# EasyEDA Pro project lovelessing-d133-mobile-phone-development-bo-91bf7213.epro, board PCB2_1
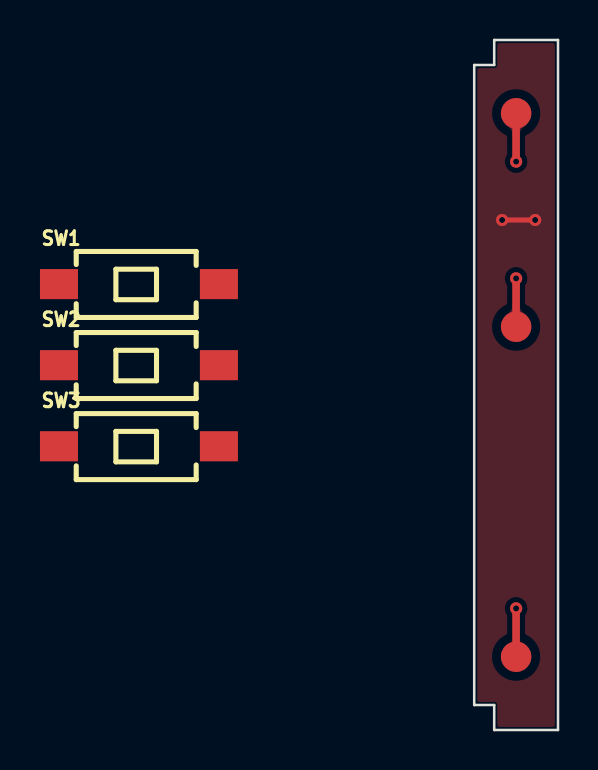
[diagram p11: board, top side]
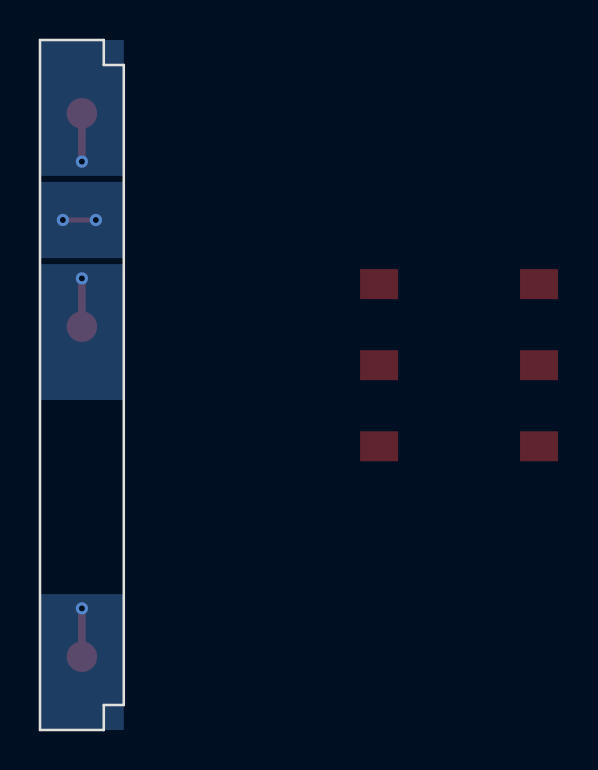
[diagram p12: board, bottom side, seen from below]

Outline 4.19 x 34.5 mm; copper layers: Top Layer, Bottom Layer. Coordinates in mm from the lower left corner of the outline.
Outline path: 0,1.25 0,33.25 1,33.25 1,34.5 4.19,34.5 4.19,0 1,0 1,1.25 0,1.25
Stack: Top Layer 0.035mm / Dielectric1 0.91mm FR4 er 4.5 / Bottom Layer 0.035mm

## Design rules (mm)
spacing copperThickness1oz (default): track to track 0.102, other pairs 0.152 to 0.3
spacing copperThickness2oz: track to track 0.203, other pairs 0.152 to 0.3
spacing Plane_innerPlane: track to track 0.102, other pairs 0.152 to 0.3
spacing Copper_copperRegion: track to track 0.102, other pairs 0.152 to 0.3
track width copperThickness1oz (default): min 0.127, default 0.254, max 2.54
track width copperThickness2oz: min 0.203, default 0.254, max 2.54
differential pair differentialPair (default): width min 0.127, default 0.254, max 2.54; gap min 0.152, default 0.152
pour e27 uses Copper_copperRegion

## Placement (name value [footprint] x y rotation side)
NOREF  -  [Pad_e8]  2.1 3.66 0 top
NOREF#2  -  [Pad_e6]  2.1 30.83 0 top
NOREF#3  -  [Pad_e7]  2.1 20.16 0 top
SW1  TS-1101-C-W  [SW-SMD_L6.0-W3.3-LS8.0]  -16.77 22.29 0 top
SW2  TS-1101-C-W  [SW-SMD_L6.0-W3.3-LS8.0]  -16.77 18.24 0 top
SW3  TS-1101-C-W  [SW-SMD_L6.0-W3.3-LS8.0]  -16.77 14.19 0 top

## Footprints (pads in the part's own frame, mm; a bottom-side part is the same pattern mirrored in y, then rotated)
Pad_e6
  round 1.524 smd: 1(0,0)
Pad_e7
  round 1.524 smd: 1(0,0)
Pad_e8
  round 1.524 smd: 1(0,0)
SW-SMD_L6.0-W3.3-LS8.0
  rect 1.9x1.5 smd: 1(-4,0) 2(4,0)

## Nets
GND: SW1.1 SW2.1 SW3.1
KEY1: NOREF#2.1 SW1.2
KEY2: NOREF#3.1 SW2.2
KEY3: NOREF.1 SW3.2

## Via types
v1: diameter 0.61, hole 0.305, Top Layer to Bottom Layer, 5 vias

## Routing (per net, layer and track width the routed paths; a pad name or vN(x,y) marks a point on that pad's centre or on a via; arc(x,y) is an arc through that point)
GND: length 1.7
  Top Layer w0.254: v1(1.4,25.5) 3.05,25.5
  vias: v1(3.05,25.5)
KEY1: length 2.4
  Top Layer w0.381: NOREF#2.1 v1(2.1,28.42)
KEY2: length 2.4
  Top Layer w0.381: NOREF#3.1 v1(2.1,22.58)
KEY3: length 2.4
  Top Layer w0.381: NOREF.1 v1(2.1,6.08)

## Copper pours and planes (outline as drawn; the poured copper is in the pictures)
GND on Top Layer: -0.51,34.9 4.57,34.9 4.57,-0.28 -0.51,-0.28
GND on Bottom Layer: 0,27.41 4.19,27.41 4.19,23.6 0,23.6
KEY1 on Bottom Layer: 0,34.5 4.19,34.5 4.19,27.71 0,27.71
KEY2 on Bottom Layer: 0,23.29 4.19,23.29 4.19,16.5 0,16.5
KEY3 on Bottom Layer: 0,6.79 4.19,6.79 4.19,0 0,0

Small or netless copper shapes (teardrops, artwork), in the pictures only: 4 on Top Layer
